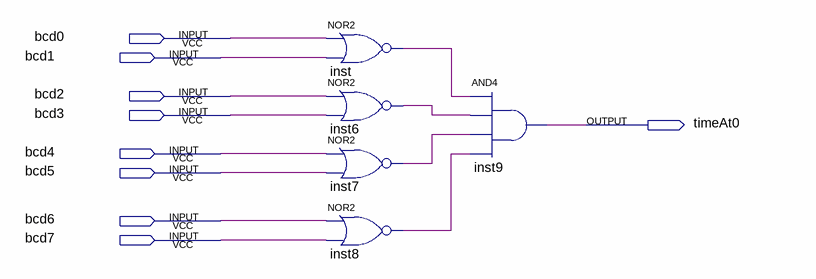
[diagram p0: schematic sheet]
// Quartus schematic timeCheckBlock.bdf as structural Verilog: 5 symbols, 9 pins
module timeCheckBlock (
  input  bcd0,
  input  bcd1,
  input  bcd2,
  input  bcd3,
  input  bcd4,
  input  bcd5,
  input  bcd6,
  input  bcd7,
  output timeAt0
);

  wire inst6_out, inst7_out, inst8_out, inst_out;

  nor inst (inst_out, bcd0, bcd1);
  nor inst6 (inst6_out, bcd2, bcd3);
  nor inst7 (inst7_out, bcd4, bcd5);
  nor inst8 (inst8_out, bcd6, bcd7);
  and inst9 (timeAt0, inst_out, inst6_out, inst7_out, inst8_out);
endmodule
